# Altium schematic sheet 06_Clock_Reset_Boot.SchDoc
size 812 x 508 mm; SheetNumber: 6; SheetTotal: 16
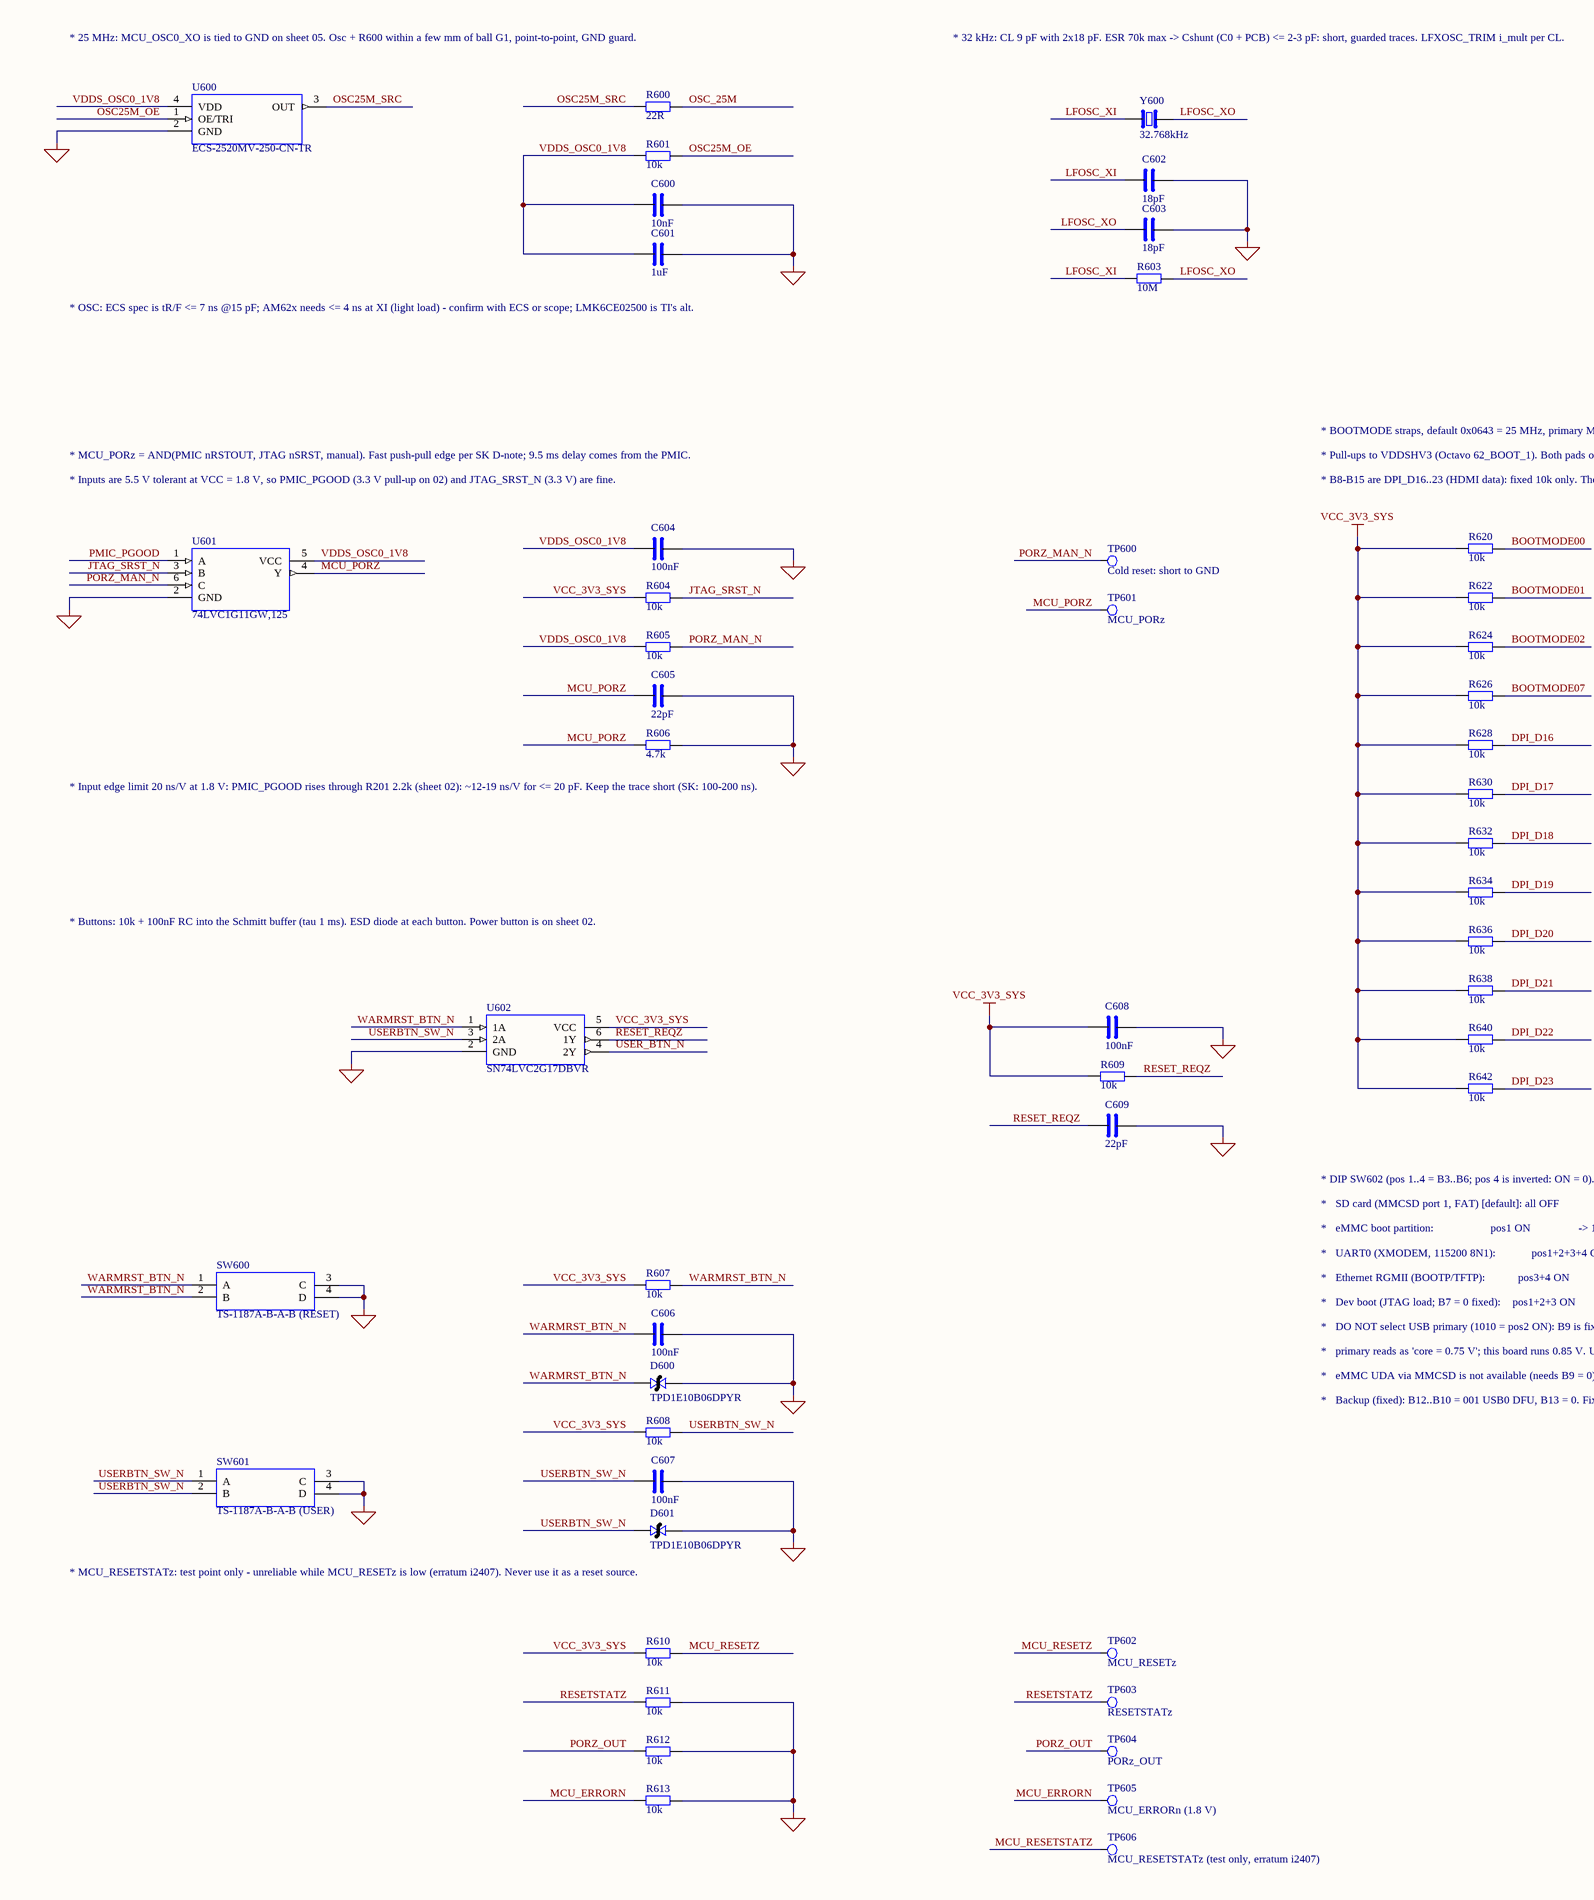
[diagram p0: 06_Clock_Reset_Boot.SchDoc, left]
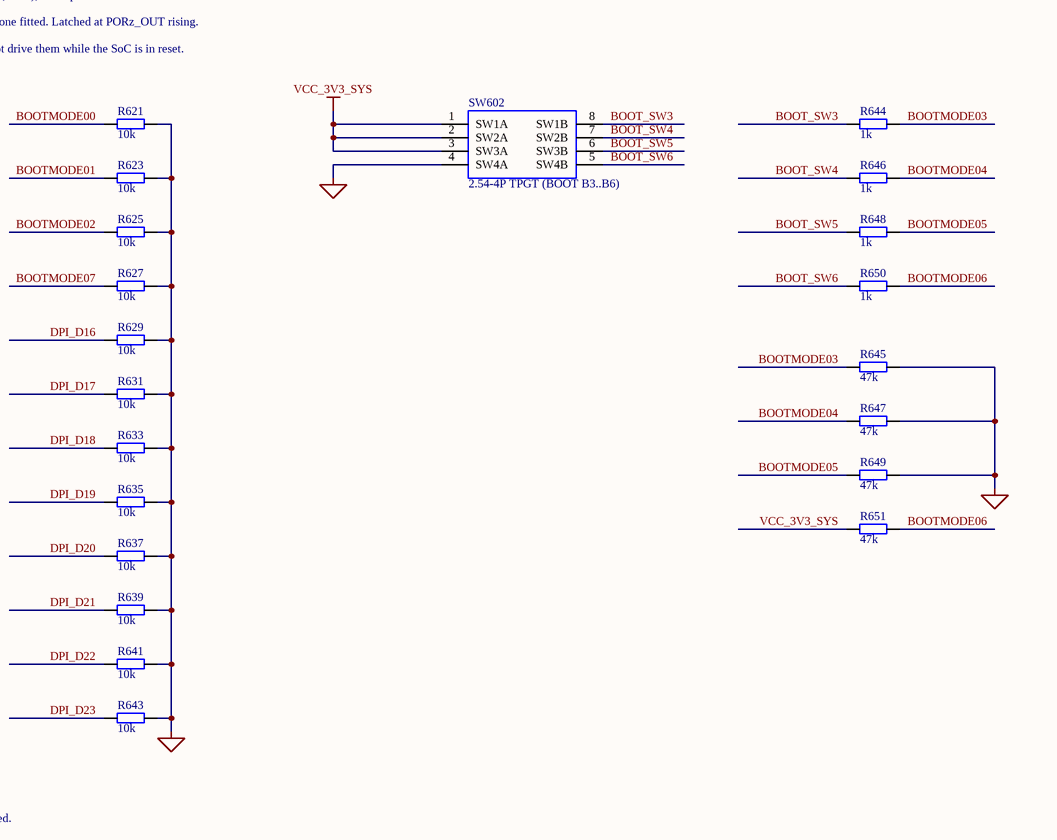
[diagram p1: 06_Clock_Reset_Boot.SchDoc, right]

## Parts
C600  10nF  [C0402]
C601  1uF  [C0402]
C602  18pF  [C0402]
C603  18pF  [C0402]
C604  100nF  [C0402]
C605  22pF  [C0402]
C606  100nF  [C0402]
C607  100nF  [C0402]
C608  100nF  [C0402]
C609  22pF  [C0402]
D600  TPD1E10B06DPYR  [X1SON2_DPY]
D601  TPD1E10B06DPYR  [X1SON2_DPY]
R600  22R  [R0402]
R601  10k  [R0402]
R603  10M  [R0402]
R604  10k  [R0402]
R605  10k  [R0402]
R606  4.7k  [R0402]
R607  10k  [R0402]
R608  10k  [R0402]
R609  10k  [R0402]
R610  10k  [R0402]
R611  10k  [R0402]
R612  10k  [R0402]
R613  10k  [R0402]
R620  10k  [R0402]
R621  10k  [R0402]
R622  10k  [R0402]
R623  10k  [R0402]
R624  10k  [R0402]
R625  10k  [R0402]
R626  10k  [R0402]
R627  10k  [R0402]
R628  10k  [R0402]
R629  10k  [R0402]
R630  10k  [R0402]
R631  10k  [R0402]
R632  10k  [R0402]
R633  10k  [R0402]
R634  10k  [R0402]
R635  10k  [R0402]
R636  10k  [R0402]
R637  10k  [R0402]
R638  10k  [R0402]
R639  10k  [R0402]
R640  10k  [R0402]
R641  10k  [R0402]
R642  10k  [R0402]
R643  10k  [R0402]
R644  1k  [R0402]
R645  47k  [R0402]
R646  1k  [R0402]
R647  47k  [R0402]
R648  1k  [R0402]
R649  47k  [R0402]
R650  1k  [R0402]
R651  47k  [R0402]
SW600  TS-1187A-B-A-B (RESET)  [SW_TACT_5.1X5.1_SMD4]
SW601  TS-1187A-B-A-B (USER)  [SW_TACT_5.1X5.1_SMD4]
SW602  2.54-4P TPGT (BOOT B3..B6)  [SW_DIP4_SMD_2.54]
TP600  Cold reset: short to GND  [TP_PAD_1.0]
TP601  MCU_PORz  [TP_PAD_1.0]
TP602  MCU_RESETz  [TP_PAD_1.0]
TP603  RESETSTATz  [TP_PAD_1.0]
TP604  PORz_OUT  [TP_PAD_1.0]
TP605  MCU_ERRORn (1.8 V)  [TP_PAD_1.0]
TP606  MCU_RESETSTATz (test only, erratum i2407)  [TP_PAD_1.0]
U600  ECS-2520MV-250-CN-TR  [OSC_2520_4P]
U601  74LVC1G11GW,125  [SC70-6]
U602  SN74LVC2G17DBVR  [SOT23-6]
Y600  32.768kHz  [XTAL_EPSON_FC-135]

## Nets
GND: C600.2 C601.2 C602.2 C603.2 C604.2 C605.2 C606.2 C607.2 C608.2 C609.2 D600.2 D601.2 R606.2 R611.2 R612.2 R613.2 R621.2 R623.2 R625.2 R627.2 R629.2 R631.2 R633.2 R635.2 R637.2 R639.2 R641.2 R643.2 R645.2 R647.2 R649.2 SW600.3(C) SW600.4(D) SW601.3(C) SW601.4(D) SW602.4(SW4A) U600.2(GND) U601.2(GND) U602.2(GND)
VCC_3V3_SYS: C608.1 R604.1 R607.1 R608.1 R609.1 R610.1 R620.1 R622.1 R624.1 R626.1 R628.1 R630.1 R632.1 R634.1 R636.1 R638.1 R640.1 R642.1 R651.1 SW602.1(SW1A) SW602.2(SW2A) SW602.3(SW3A) U602.5(VCC)
BOOT_SW3: R644.1 SW602.8(SW1B)
BOOT_SW4: R646.1 SW602.7(SW2B)
BOOT_SW5: R648.1 SW602.6(SW3B)
BOOT_SW6: R650.1 SW602.5(SW4B)
BOOTMODE00: R620.2 R621.1
BOOTMODE01: R622.2 R623.1
BOOTMODE02: R624.2 R625.1
BOOTMODE03: R644.2 R645.1
BOOTMODE04: R646.2 R647.1
BOOTMODE05: R648.2 R649.1
BOOTMODE06: R650.2 R651.2
BOOTMODE07: R626.2 R627.1
DPI_D16: R628.2 R629.1
DPI_D17: R630.2 R631.1
DPI_D18: R632.2 R633.1
DPI_D19: R634.2 R635.1
DPI_D20: R636.2 R637.1
DPI_D21: R638.2 R639.1
DPI_D22: R640.2 R641.1
DPI_D23: R642.2 R643.1
JTAG_SRST_N: R604.2 U601.3(B)
LFOSC_XI: C602.1 R603.1 Y600.1
LFOSC_XO: C603.1 R603.2 Y600.2
MCU_ERRORN: R613.1 TP605.1(TP)
MCU_PORZ: C605.1 R606.1 TP601.1(TP) U601.4(Y)
MCU_RESETSTATZ: TP606.1(TP)
MCU_RESETZ: R610.2 TP602.1(TP)
OSC25M_OE: R601.2 U600.1(OE/TRI)
OSC25M_SRC: R600.1 U600.3(OUT)
OSC_25M: R600.2
PMIC_PGOOD: U601.1(A)
PORZ_MAN_N: R605.2 TP600.1(TP) U601.6(C)
PORZ_OUT: R612.1 TP604.1(TP)
RESET_REQZ: C609.1 R609.2 U602.6(1Y)
RESETSTATZ: R611.1 TP603.1(TP)
USER_BTN_N: U602.4(2Y)
USERBTN_SW_N: C607.1 D601.1 R608.2 SW601.1(A) SW601.2(B) U602.3(2A)
VDDS_OSC0_1V8: C600.1 C601.1 C604.1 R601.1 R605.1 U600.4(VDD) U601.5(VCC)
WARMRST_BTN_N: C606.1 D600.1 R607.2 SW600.1(A) SW600.2(B) U602.1(1A)

## Notes on the sheet
- * 25 MHz: MCU_OSC0_XO is tied to GND on sheet 05. Osc + R600 within a few mm of ball G1, point-to-point, GND guard.
- * 32 kHz: CL 9 pF with 2x18 pF. ESR 70k max -> Cshunt (C0 + PCB) <= 2-3 pF: short, guarded traces. LFXOSC_TRIM i_mult per CL.
- * OSC: ECS spec is tR/F <= 7 ns @15 pF; AM62x needs <= 4 ns at XI (light load) - confirm with ECS or scope; LMK6CE02500 is TI's alt.
- * BOOTMODE straps, default 0x0643 = 25 MHz, primary MMCSD port 1 (SD, FAT), backup USB DFU.
- * MCU_PORz = AND(PMIC nRSTOUT, JTAG nSRST, manual). Fast push-pull edge per SK D-note; 9.5 ms delay comes from the PMIC.
- * Inputs are 5.5 V tolerant at VCC = 1.8 V, so PMIC_PGOOD (3.3 V pull-up on 02) and JTAG_SRST_N (3.3 V) are fine.
- * Pull-ups to VDDSHV3 (Octavo 62_BOOT_1). Both pads on every fixed bit, one fitted. Latched at PORz_OUT rising.
- * B8-B15 are DPI_D16..23 (HDMI data): fixed 10k only. The TFP410 must not drive them while the SoC is in reset.
- (near R606) * Input edge limit 20 ns/V at 1.8 V: PMIC_PGOOD rises through R201 2.2k (sheet 02): ~12-19 ns/V for <= 20 pF. Keep the trace short (SK: 100-200 ns).
- * Buttons: 10k + 100nF RC into the Schmitt buffer (tau 1 ms). ESD diode at each button. Power button is on sheet 02.
- * DIP SW602 (pos 1..4 = B3..B6; pos 4 is inverted: ON = 0). OFF = as delivered.
- *   SD card (MMCSD port 1, FAT) [default]: all OFF                -> B6..B3 = 1000
- *   eMMC boot partition:                   pos1 ON                -> 1001
- *   UART0 (XMODEM, 115200 8N1):            pos1+2+3+4 ON          -> 0111
- *   Ethernet RGMII (BOOTP/TFTP):           pos3+4 ON              -> 0100 (B9=1: ROM drives 25 MHz on CLKOUT0 = ball D16 = header pin 7)
- *   Dev boot (JTAG load; B7 = 0 fixed):    pos1+2+3 ON            -> 1111 (true No-boot needs B7 = 1)
- *   DO NOT select USB primary (1010 = pos2 ON): B9 is fixed 1, which USB
- *   primary reads as 'core = 0.75 V'; this board runs 0.85 V. Use the USB DFU backup instead.
- *   eMMC UDA via MMCSD is not available (needs B9 = 0); use the eMMC boot partition mode.
- *   Backup (fixed): B12..B10 = 001 USB0 DFU, B13 = 0. Fixed: B2..B0 = 011, B7 = 0, B8 = 0, B15..B14 = 00.
- (near D601) * MCU_RESETSTATz: test point only - unreliable while MCU_RESETz is low (erratum i2407). Never use it as a reset source.

## Library data of the parts
C600 = CAP: Capacitor, non-polarized; Spec: 10nF 50V X7R 0402 (osc VDD)
C601 = CAP: Capacitor, non-polarized; Spec: 1uF 10V X5R 0402 (osc VDD)
C602 = CAP: Capacitor, non-polarized; Spec: 18pF 50V C0G 0402 (Cf1)
C603 = CAP: Capacitor, non-polarized; Spec: 18pF 50V C0G 0402 (Cf2)
C604 = CAP: Capacitor, non-polarized; Spec: 100nF 16V X7R 0402 (U601 VCC)
C605 = CAP: Capacitor, non-polarized; Spec: 22pF 50V C0G 0402 (glitch filter at ball D6)
C606 C607 = CAP: Capacitor, non-polarized; Spec: 100nF 16V X7R 0402 (debounce)
C608 = CAP: Capacitor, non-polarized; Spec: 100nF 16V X7R 0402 (U602 VCC)
C609 = CAP: Capacitor, non-polarized; Spec: 22pF 50V C0G 0402 (glitch filter at ball D17)
D600 D601 = TVS_BI: Bidirectional TVS / ESD diode; Manufacturer: Texas Instruments; MPN: TPD1E10B06DPYR
R600 = RES: Resistor; Spec: 22R 1% 0402 (series term. at the oscillator)
R601 = RES: Resistor; Spec: 10k 1% 0402 (OE pull-up, SK R370)
R603 = RES: Resistor; DNP: 1; Spec: 10M 1% 0402 (Rbias option, DS Fig 6-21 gives no value)
R604 = RES: Resistor; Spec: 10k 1% 0402 (gate enabled with no debugger)
R605 = RES: Resistor; Spec: 10k 1% 0402 (spare input high)
R606 = RES: Resistor; Spec: 4.7k 1% 0402 (SK R201; holds PORz low when U601 is unpowered)
R607 R608 = RES: Resistor; Spec: 10k 1% 0402
R609 = RES: Resistor; Spec: 10k 1% 0402 (Octavo 62_RESET_6)
R610 = RES: Resistor; Spec: 10k 1% 0402 (Octavo 62_CONFIG_4, 62_RESET_4)
R611 = RES: Resistor; Spec: 10k 1% 0402 (RESETSTATz pull-down, as SK; SoC load 0.33 mA)
R612 = RES: Resistor; Spec: 10k 1% 0402 (holds peripherals in reset)
R613 = RES: Resistor; Spec: 10k 1% 0402 (DS Table 5-74: pull-down)
R620 = RES: Resistor; Spec: 10k 1% 0402 (B0 = 1: PLL ref 011 = 25 MHz)
R621 = RES: Resistor; DNP: 1; Spec: 10k 1% 0402 DNP (B0 = 1: PLL ref 011 = 25 MHz)
R622 = RES: Resistor; Spec: 10k 1% 0402 (B1 = 1: PLL ref)
R623 = RES: Resistor; DNP: 1; Spec: 10k 1% 0402 DNP (B1 = 1: PLL ref)
R624 = RES: Resistor; DNP: 1; Spec: 10k 1% 0402 DNP (B2 = 0: PLL ref)
R625 = RES: Resistor; Spec: 10k 1% 0402 (B2 = 0: PLL ref)
R626 = RES: Resistor; DNP: 1; Spec: 10k 1% 0402 DNP (B7 = 0: MMCSD FS/raw: 0 = FAT)
R627 = RES: Resistor; Spec: 10k 1% 0402 (B7 = 0: MMCSD FS/raw: 0 = FAT)
R628 = RES: Resistor; DNP: 1; Spec: 10k 1% 0402 DNP (B8 = 0: rsvd for MMCSD)
R629 = RES: Resistor; Spec: 10k 1% 0402 (B8 = 0: rsvd for MMCSD)
R630 = RES: Resistor; Spec: 10k 1% 0402 (B9 = 1: MMCSD port: 1 = MMC1 (SD))
R631 = RES: Resistor; DNP: 1; Spec: 10k 1% 0402 DNP (B9 = 1: MMCSD port: 1 = MMC1 (SD))
R632 = RES: Resistor; Spec: 10k 1% 0402 (B10 = 1: backup 001 = USB)
R633 = RES: Resistor; DNP: 1; Spec: 10k 1% 0402 DNP (B10 = 1: backup 001 = USB)
R634 = RES: Resistor; DNP: 1; Spec: 10k 1% 0402 DNP (B11 = 0: backup)
R635 = RES: Resistor; Spec: 10k 1% 0402 (B11 = 0: backup)
R636 = RES: Resistor; DNP: 1; Spec: 10k 1% 0402 DNP (B12 = 0: backup)
R637 = RES: Resistor; Spec: 10k 1% 0402 (B12 = 0: backup)
R638 = RES: Resistor; DNP: 1; Spec: 10k 1% 0402 DNP (B13 = 0: backup USB mode: 0 = DFU)
R639 = RES: Resistor; Spec: 10k 1% 0402 (B13 = 0: backup USB mode: 0 = DFU)
R640 = RES: Resistor; DNP: 1; Spec: 10k 1% 0402 DNP (B14 = 0: reserved)
R641 = RES: Resistor; Spec: 10k 1% 0402 (B14 = 0: reserved)
R642 = RES: Resistor; DNP: 1; Spec: 10k 1% 0402 DNP (B15 = 0: reserved)
R643 = RES: Resistor; Spec: 10k 1% 0402 (B15 = 0: reserved)
R644 = RES: Resistor; Spec: 1k 1% 0402 (DIP pos 1 ON -> B3 = 1)
R645 = RES: Resistor; Spec: 47k 1% 0402 (B3 OFF = 0)
R646 = RES: Resistor; Spec: 1k 1% 0402 (DIP pos 2 ON -> B4 = 1)
R647 = RES: Resistor; Spec: 47k 1% 0402 (B4 OFF = 0)
R648 = RES: Resistor; Spec: 1k 1% 0402 (DIP pos 3 ON -> B5 = 1)
R649 = RES: Resistor; Spec: 47k 1% 0402 (B5 OFF = 0)
R650 = RES: Resistor; Spec: 1k 1% 0402 (DIP pos 4 ON -> B6 = 0)
R651 = RES: Resistor; Spec: 47k 1% 0402 (B6 OFF = 1)
SW600 SW601 = TS-1187A: Tactile switch SPST-NO 5.1x5.1 mm, 4 terminals (A=B, C=D); Manufacturer: XKB Connection; MPN: TS-1187A-B-A-B
SW602 = DIPSW4_SMD: DIP switch 4-position SPST, 2.54 mm SMD (pos k = pins k / 9-k); Manufacturer: SHOU HAN; MPN: 2.54-4P TPGT
TP600-TP606 = TESTPOINT: Test point
U600 = ECS-2520MV: 25 MHz HCMOS oscillator 1.6-3.6 V, 2.5x2.0 mm SMD-4; Manufacturer: ECS Inc; MPN: ECS-2520MV-250-CN-TR
U601 = SN74LVC1G11_DCK: Single 3-input AND gate, SC70-6; Manufacturer: Nexperia; MPN: 74LVC1G11GW,125; LCSC: C282348; Supplier: Mouser 771-LVC1G11GW125
U602 = SN74LVC2G17_DBV: Dual Schmitt-trigger buffer, SOT-23-6; Manufacturer: Texas Instruments; MPN: SN74LVC2G17DBVR
Y600 = XTAL2: Crystal, 2-terminal; MPN: Q13FC13500003; Manufacturer: Seiko Epson; Spec: 32.768kHz 9pF 20ppm Q13FC13500003